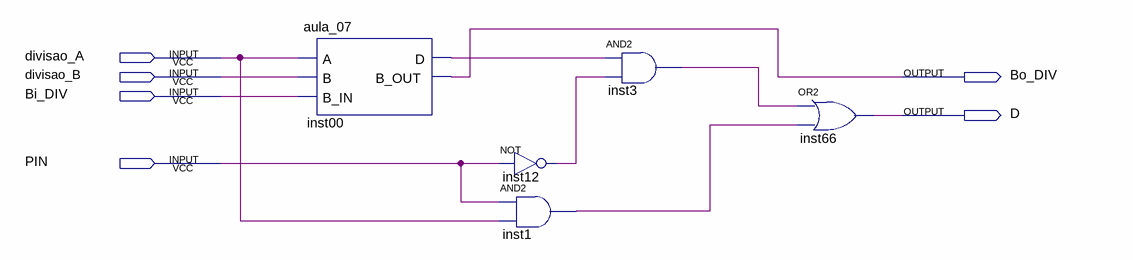
[diagram p0: schematic sheet]
// Quartus schematic DIV.bdf as structural Verilog: 5 symbols, 6 pins
module DIV (
  input  divisao_A,
  input  divisao_B,
  input  Bi_DIV,
  input  PIN,
  output Bo_DIV,
  output D
);

  wire inst00_d, inst1_out, inst3_out, inst12_out;

  aula_07 inst00 (.A(divisao_A), .B(divisao_B), .B_IN(Bi_DIV), .D(inst00_d), .B_OUT(Bo_DIV));
  not inst12 (inst12_out, PIN);
  and inst1 (inst1_out, PIN, divisao_A);
  and inst3 (inst3_out, inst00_d, inst12_out);
  or inst66 (D, inst3_out, inst1_out);
endmodule
